# Altium schematic sheet Power Sheet.SchDoc
size A4; SheetNumber: 2; SheetTotal: 5
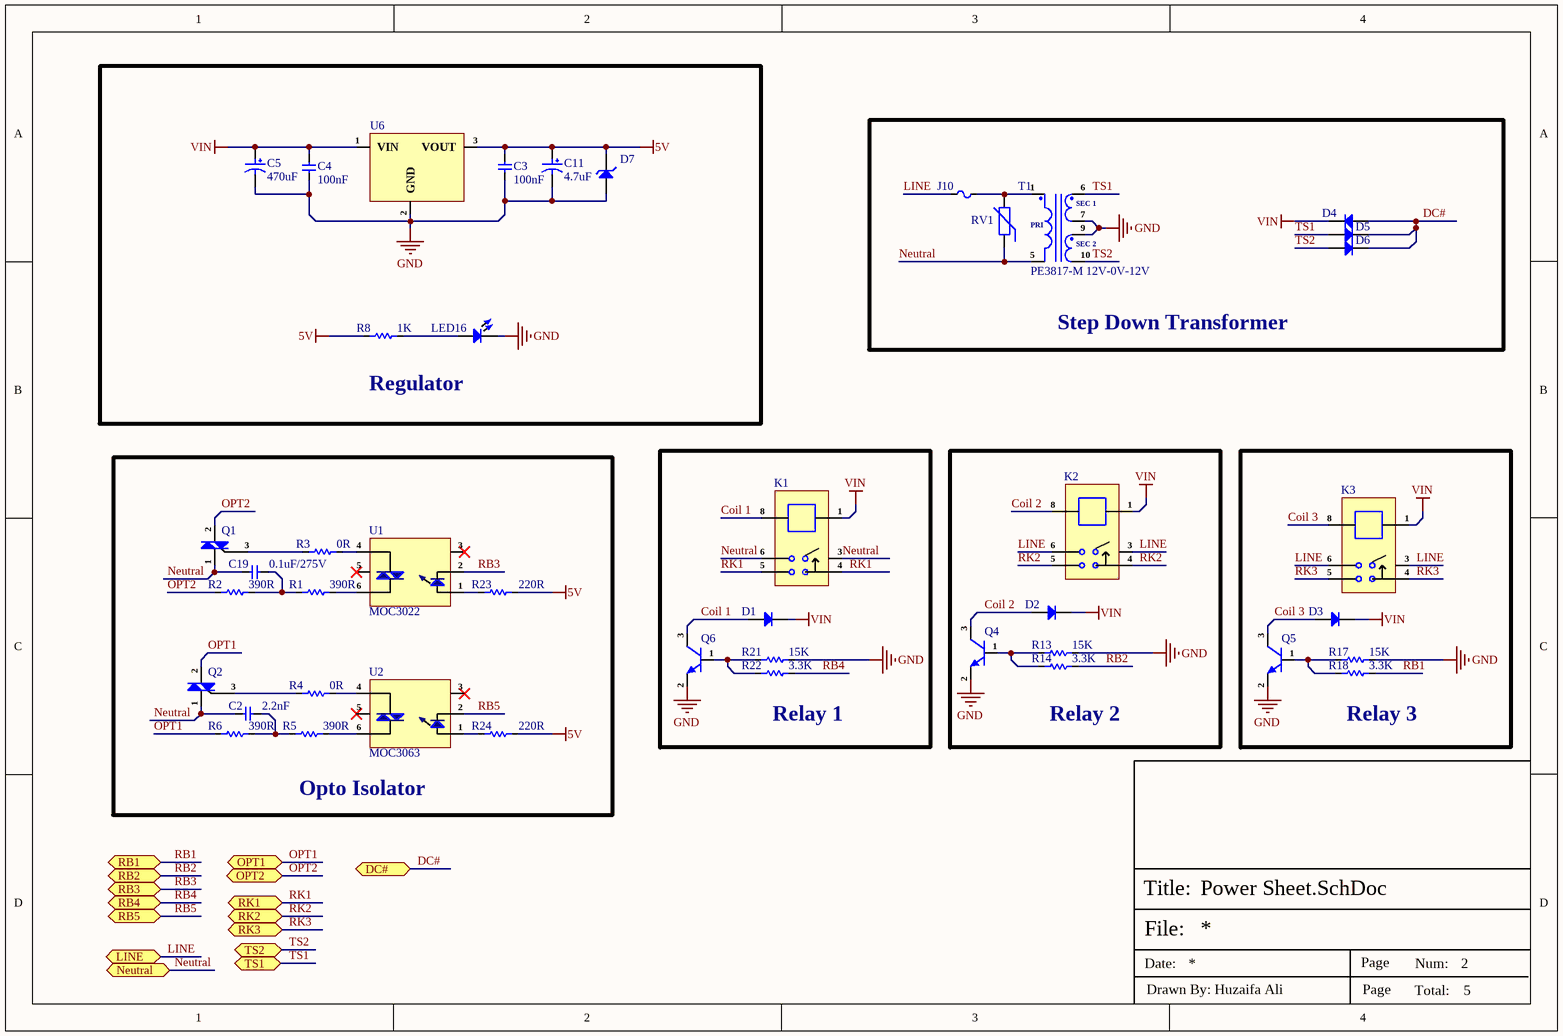
[diagram p0: Power Sheet.SchDoc]

## Parts
C2  2.2nF  [R08E1E222MN0B0S0N0]
C3  100nF  [Cap-0603]
C4  100nF  [Cap-0603]
C5  470uF  [GR1V471M1013]
C11  4.7uF  [ERS1KM4R7D11OT]
C19  0.1uF/275V  [MPX104K31C3KN15600]
D1  1N4148W-7-F  [SOD-123]  (value not drawn)
D2  1N4148W-7-F  [SOD-123]  (value not drawn)
D3  1N4148W-7-F  [SOD-123]  (value not drawn)
D4  1N4007  [DO-41]  (value not drawn)
D5  1N4007  [DO-41]  (value not drawn)
D6  1N4007  [DO-41]  (value not drawn)
D7  P6KE7.5A  [DO-15]  (value not drawn)
J10  0PTF0078P  [0PTF0078P]  (value not drawn)
K1  G5RL-1A-E-HRDC12  [G5RL-1A-E-HRDC12]  (value not drawn)
K2  G5RL-1A-E-HRDC12  [G5RL-1A-E-HRDC12]  (value not drawn)
K3  G5RL-1A-E-HRDC12  [G5RL-1A-E-HRDC12]  (value not drawn)
LED16  Blue  [LED-0603]  (value not drawn)
Q1  BTA16-600BRG  [TO-220]  (value not drawn)
Q2  BTA16-600BRG  [TO-220]  (value not drawn)
Q4  BC817 6B 160-400  [SOT-23]  (value not drawn)
Q5  BC817 6B 160-400  [SOT-23]  (value not drawn)
Q6  BC817 6B 160-400  [SOT-23]  (value not drawn)
R1  390R  [TH390R]
R2  390R  [TH390R]
R3  0R  [MFR50S-T-52-0R]
R4  0R  [MFR50S-T-52-0R]
R5  390R  [TH390R]
R6  390R  [TH390R]
R8  1K  [Res-0603]
R13  15K  [Res-0603]
R14  3.3K  [Res-0603]
R17  15K  [Res-0603]
R18  3.3K  [Res-0603]
R21  15K  [Res-0603]
R22  3.3K  [Res-0603]
R23  220R  [Res-0603]
R24  220R  [Res-0603]
RV1  14D431K  [14D431K]  (value not drawn)
T1  PE3817-M 12V-0V-12V  [PE3817-M 12V-0V-12V]
U1  MOC3022  [6 Pin Dip]
U2  MOC3063  [6 Pin Dip]
U6  L7805ABV  [TO-220]  (value not drawn)

## Blocks framed on the sheet
Regulator: C3-C5 C11 D7 LED16 R8 U6
Step Down Transformer: D4-D6 J10 RV1 T1
Opto Isolator: C2 C19 Q1 Q2 R1-R6 R23 R24 U1 U2
Relay 1: D1 K1 Q6 R21 R22
Relay 2: D2 K2 Q4 R13 R14
Relay 3: D3 K3 Q5 R17 R18

## Ports
DC# (bidir, see Top Sheet[2B], Controller Sheet[1D]), LINE (bidir, see Top Sheet[2A], Connector Sheet[1D]), Neutral (bidir, see Top Sheet[2B], Connector Sheet[1D]), OPT1 (bidir, see Top Sheet[2B], Connector Sheet[1D]), OPT2 (bidir, see Top Sheet[2B], Connector Sheet[1D]), RB1 (bidir, see Top Sheet[2B], Controller Sheet[1D]), RB2 (bidir, see Top Sheet[2B], Controller Sheet[1D]), RB3 (bidir, see Top Sheet[2B], Controller Sheet[1D]), RB4 (bidir, see Top Sheet[2B], Controller Sheet[1D]), RB5 (bidir, see Top Sheet[2B], Controller Sheet[1D]), RK1 (bidir, see Top Sheet[2B], Connector Sheet[1D]), RK2 (bidir, see Top Sheet[2B], Connector Sheet[1D]), RK3 (bidir, see Top Sheet[2B], Connector Sheet[1D]), TS1 (bidir, see Top Sheet[2B], Connector Sheet[1D]), TS2 (bidir, see Top Sheet[2B], Connector Sheet[1D])

## Nets
5V: C3.1 C11.1 D7.1(K) R8.1 R23.2 R24.2 U6.3(VOUT)
GND: C3.2 C4.1 C5.2 C11.2 D7.2(A) LED16.2 Q4.2(E) Q5.2(E) Q6.2(E) R13.2 R17.2 R21.2 T1.7 T1.9 U6.2(GND)
VIN: C4.2 C5.1 D1.2(K) D2.2(K) D3.2(K) D4.2(K) K1.1 K2.1 K3.1 U6.1(VIN)
Coil 1: D1.1(A) K1.8 Q6.3(C)
Coil 2: D2.1(A) K2.8 Q4.3(C)
Coil 3: D3.1(A) K3.8 Q5.3(C)
DC#: D4.1(A) D5.2(K) D6.2(K) ; port DC#
LINE: J10.2 K2.3 K2.6 K3.3 K3.6 ; port LINE
Neutral: C2.1 C19.1 K1.3 K1.6 Q1.1(A1) Q2.1(A1) RV1.1 T1.5 ; port Neutral
OPT1: Q2.2(A2) R6.1 ; port OPT1
OPT2: Q1.2(A2) R2.1 ; port OPT2
RB1: R18.2 ; port RB1
RB2: R14.2 ; port RB2
RB3: U1.2(Ca) ; port RB3
RB4: R22.2 ; port RB4
RB5: U2.2(Ca) ; port RB5
RK1: K1.4 K1.5 ; port RK1
RK2: K2.4 K2.5 ; port RK2
RK3: K3.4 K3.5 ; port RK3
TS1: D5.1(A) T1.6 ; port TS1
TS2: D6.1(A) T1.10 ; port TS2
NetC2_2: C2.2 R5.1 R6.2
NetC19_2: C19.2 R1.1 R2.2
NetJ10_1: J10.1 RV1.2 T1.1
NetLED16_1: LED16.1 R8.2
NetQ1_3: Q1.3(G) R3.1
NetQ2_3: Q2.3(G) R4.1
NetQ4_1: Q4.1(B) R13.1 R14.1
NetQ5_1: Q5.1(B) R17.1 R18.1
NetQ6_1: Q6.1(B) R21.1 R22.1
NetR1_2: R1.2 U1.6(Terminal)
NetR3_2: R3.2 U1.4(Terminal)
NetR4_2: R4.2 U2.4(Terminal)
NetR5_2: R5.2 U2.6(Terminal)
NetR23_1: R23.1 U1.1(An)
NetR24_1: R24.1 U2.1(An)

Not connected (* = marked no-connect by the designer): U1 3(NC)* 5(Substrate)*; U2 3(NC)* 5(Substrate)*

## Notes on the sheet
- File:
- Title:
- Date:
- Page
- Num:
- Total:
- Drawn By: Huzaifa Ali
- (in symbol PE3817-M 12V-0V-12V) SEC 1; PRI; SEC 2

## Library data of the parts
C2 = R08E1E222MN0B0S0N0: ±20% 2.2nF Y5U 2kV Plugin,P=7.5mm Ceramic Disc Capacitors ROHS; Manufacturer: STE; Manufacturer Part Number: R08E1E222MN0B0S0N0; Package: Plugin,P=7.5mm; LCSC Part Number: C2914748; Item Type: Ceramic Disc Capacitor; ComponentLink1Description: LCSC; ComponentLink1URL: https://www.lcsc.com/product-detail/Ceramic-Disc-Capacitors_STE-Songtian-Elec-R08E1E222MN0B0S0N0_C2914748.html
C3 C4 = CC0603KRX5R9BB104: CAP CER 0.1UF 50V X5R 0603; Manufacturer: Yageo; Tolerance: 10%; Item Type: Capacitor; Supplier 1: Digi-Key; Manufacturer Part Number: CC0603KRX5R9BB104; RoHS: Yes; Category: Ceramic Capacitors; Stock 1: 152253; Pricing 1: 1=0.10000, 10=0.05200, 50=0.02820, 100=0.02310, 500=0.01648, 1000=0.01294 (USD); Mount: Surface Mount; Case/Package: 0603; Case Code (Imperial): 0603; Case Code (Metric): 1608; Weight: 7.1E-05oz; Min Operating Temperature: -55°C; Max Operating Temperature: 85°C; Capacitance: 100nF; Packaging: Tape and Reel; Voltage Rating: 50V; Dielectric: X5R; Termination: SMD/SMT; Voltage Rating (DC): 50V; Package Quantity: 4000; Length: 0.063inch; Width: 0.031inch; Thickness: 0.035inch; Lead Free: Lead Free; Halogen Free: Halogen Free; ComponentLink1URL: http://www.mouser.com/ds/2/447/Yageo_UPY-GP_NP0_16V-to-50V_9-358835.pdf?src-supplier=Mouser; ComponentLink1Description: http://www.mouser.com/ds/2/447/Yageo_UPY-GP_NP0_16V-to-50V_9-358835.pdf?src-supplier=Mouser; ComponentLink2URL: https://www.yageo.com/upload/media/product/productsearch/datasheet/mlcc/UPY-GPHC_X5R_4V-to-50V_26.pdf?src-supplier=Digi-Key; ComponentLink2Description: https://www.yageo.com/upload/media/product/productsearch/datasheet/mlcc/UPY-GPHC_X5R_4V-to-50V_26.pdf?src-supplier=Digi-Key; ComponentLink3URL: http://www.yageo.com/exep/pages/download/literatures/ProductSelectionGuide%202014_Final_2.pdf?src-supplier=Digi-Key; ComponentLink3Description: http://www.yageo.com/exep/pages/download/literatures/ProductSelectionGuide%202014_Final_2.pdf?src-supplier=Digi-Key; Supplier Part Number 1: 311-4046-1-ND; LCSC Part Number: C110022
C5 = GR1V471M1013: 470uF 35V ±20% Plugin,D10xL13mm Aluminum Electrolytic Capacitors - Leaded ROHS; Manufacturer: ROQANG; Manufacturer Part Number: GR1V471M1013; Package: Plugin,D10xL13mm; LCSC Part Number: C2873995; Item Type: Capacitor; ComponentLink1Description: LCSC; ComponentLink1URL: https://www.lcsc.com/product-detail/span-style-background-color-ff0-Aluminum-span-span-style-background-color-ff0-Electrolytic-span-span-style-background-color-ff0-Capacitors-span-span-style-background-color-ff0-Leaded-span_ROQANG-GR1V471M1013_C2873995.html
C11 = ERS1KM4R7D11OT: 4.7uF 100V ±20% Plugin,D5xL11mm Aluminum Electrolytic Capacitors - Leaded ROHS; Manufacturer: AISHI(Aihua Group); Manufacturer Part Number: ERS1KM4R7D11OT; Package: Plugin,D5xL11mm; LCSC Part Number: C106689; Item Type: Capacitor; ComponentLink1Description: LCSC; ComponentLink1URL: https://www.lcsc.com/product-detail/Aluminum-Electrolytic-Capacitors-Leaded_AISHI-Aihua-Group-ERS1KM4R7D11OT_C106689.html
C19 = MPX104K31C3KN15600: 100nF ±10% X2 Plugin,P=10mm Suppression Capacitors ROHS; Manufacturer: KNSCHA; Manufacturer Part Number: MPX104K31C3KN15600; Package: Plugin,P=10mm; LCSC Part Number: C489079; Item Type: Capacitor; ComponentLink1Description: LCSC; ComponentLink1URL: https://www.lcsc.com/product-detail/Suppression-Capacitors_KNSCHA-MPX104K31C3KN15600_C489079.html
D1-D3 = 1N4148W-7-F: DIODE GEN PURP 100V 300MA SOD123; Manufacturer: Diodes; Forward Current: 150mA; Reverse Recovery Time: 4ns; Max Forward Surge Current (Ifsm): 2A; Element Configuration: Single; Max Reverse Current: 1uA; Forward Voltage: 1.25V; Power Dissipation: 400mW; Polarity: Standard; Voltage Rating (DC): 75V; Value: 2pF; Supplier 1: Future Electronics; Manufacturer Part Number: 1N4148W-7-F; RoHS: Yes; Category: Rectifier Diodes; Stock 1: 32931000; Pricing 1: 3000=0.01840, 12000=0.01760, 45000=0.01690, 120000=0.01640, 300000=0.01560 (USD); Mounting Technology: Surface Mount; Pins: 2; Weight: 0.000353oz; Contact Plating: Tin,Matte; Min Operating Temperature: -65°C; Max Operating Temperature: 150°C; Packaging: Tape and Reel; Max Repetitive Reverse Voltage (Vrrm): 100V; Peak Non-Repetitive Surge Current: 2A; Voltage: 100V; Max Surge Current: 2A; Package Quantity: 3000; Recovery Time: 4ns; Average Rectified Current: 300mA; Power Rating: 400mW; Current Rating: 150mA; Output Current: 150mA; Max Reverse Voltage (DC): 100V; Series: -; Reverse Recovery Time-Max: 4ns; Length: 2.85mm; Width: 1.7mm; Height: 1.25mm; Radiation Hardening: No; RoHS Compliant: Yes; Reach SVHC Compliant: Yes; Lead Free: Lead Free; ComponentLink1URL: https://datasheet.ciiva.com/1179/1915529-1179304.pdf?src-supplier=Element14; ComponentLink1Description: https://datasheet.ciiva.com/1179/1915529-1179304.pdf?src-supplier=Element14; ComponentLink2URL: https://datasheet.ciiva.com/22695/1915529-22695239.pdf?src-supplier=Element14; ComponentLink2Description: https://datasheet.ciiva.com/22695/1915529-22695239.pdf?src-supplier=Element14; ComponentLink3URL: https://datasheet.ciiva.com/8300/ds30086-8300392.pdf?src-supplier=Avnet; ComponentLink3Description: https://datasheet.ciiva.com/8300/ds30086-8300392.pdf?src-supplier=Avnet; ComponentLink4URL: https://datasheet.ciiva.com/15219/getdatasheetpartid-110030-15219548.pdf?src-supplier=Verical; ComponentLink4Description: https://datasheet.ciiva.com/15219/getdatasheetpartid-110030-15219548.pdf?src-supplier=Verical; ComponentLink5URL: https://datasheet.ciiva.com/8303/ds30086-8303197.pdf?src-supplier=Avnet; ComponentLink5Description: https://datasheet.ciiva.com/8303/ds30086-8303197.pdf?src-supplier=Avnet; ComponentLink6URL: https://datasheet.ciiva.com/911/ds30086-911735.pdf?src-supplier=Digi-Key; ComponentLink6Description: https://datasheet.ciiva.com/911/ds30086-911735.pdf?src-supplier=Digi-Key; ComponentLink7URL: https://datasheet.ciiva.com/911/ds30086-911736.pdf?src-supplier=Digi-Key; ComponentLink7Description: https://datasheet.ciiva.com/911/ds30086-911736.pdf?src-supplier=Digi-Key; ComponentLink8URL: https://datasheet.ciiva.com/911/ds30086-911734.pdf?src-supplier=Digi-Key; ComponentLink8Description: https://datasheet.ciiva.com/911/ds30086-911734.pdf?src-supplier=Digi-Key; ComponentLink9URL: https://datasheet.ciiva.com/4435/ds30086-4435128.pdf?src-supplier=Mouser; ComponentLink9Description: https://datasheet.ciiva.com/4435/ds30086-4435128.pdf?src-supplier=Mouser; Supplier Part Number 1: 7634694; LCSC Part Number: C83528; Item Type: Diode
D4-D6 = 1N4007: 1A 1000V 1.1V@2A DO-41 Diodes - General Purpose ROHS; Manufacturer: JUXING; Item Type: Diode; Manufacturer Part Number: 1N4007; Package: DO-41; LCSC Part Number: C3011149; ComponentLink1Description: LCSC; ComponentLink1URL: https://www.lcsc.com/product-detail/Diodes-General-Purpose_JUXING-1N4007_C3011149.html
D7 = P6KE7.5A: TVS DIODE 6.4VWM 11.3VC DO204AC; Manufacturer: Littelfuse; Reverse Voltage: 6.4V; Supplier: Future Electronics; Supplier Part Number: 9017454; Manufacturer Part Number: P6KE7.5A; RoHS: Yes; Category: TVS Diodes; Stock: 2812; Pricing: 1=0.395, 15=0.325, 100=0.27, 400=0.235, 2000=0.189 (USD); ComponentLink1URL: https://datasheet.ciiva.com/15143/getdatasheetpartid-152329-15143807.pdf?src-supplier=Verical; ComponentLink1Description: https://datasheet.ciiva.com/15143/getdatasheetpartid-152329-15143807.pdf?src-supplier=Verical; ComponentLink2URL: https://datasheet.ciiva.com/331/littelfuse-tvs-diode-p6ke-datasheet-pdf-331007.pdf?src-supplier=Digi-Key; ComponentLink2Description: https://datasheet.ciiva.com/331/littelfuse-tvs-diode-p6ke-datasheet-pdf-331007.pdf?src-supplier=Digi-Key; ComponentLink3URL: https://datasheet.ciiva.com/331/littelfuse-tvs-diode-p6ke-datasheet-pdf-331031.pdf?src-supplier=Digi-Key; ComponentLink3Description: https://datasheet.ciiva.com/331/littelfuse-tvs-diode-p6ke-datasheet-pdf-331031.pdf?src-supplier=Digi-Key; ComponentLink4URL: https://datasheet.ciiva.com/331/littelfuse-tvs-diode-p6ke-datasheet-pdf-331032.pdf?src-supplier=Digi-Key; ComponentLink4Description: https://datasheet.ciiva.com/331/littelfuse-tvs-diode-p6ke-datasheet-pdf-331032.pdf?src-supplier=Digi-Key; ComponentLink5URL: https://datasheet.ciiva.com/4510/littelfuse-tvs-diode-p6ke-48586-4510890.pdf?src-supplier=Mouser; ComponentLink5Description: https://datasheet.ciiva.com/4510/littelfuse-tvs-diode-p6ke-48586-4510890.pdf?src-supplier=Mouser; ComponentLink6URL: https://datasheet.ciiva.com/8062/littelfuse-tvs-diode-p6ke-8062215.pdf?src-supplier=Element14; ComponentLink6Description: https://datasheet.ciiva.com/8062/littelfuse-tvs-diode-p6ke-8062215.pdf?src-supplier=Element14; LCSC Part Number: C1975000; Item Type: Diode
J10 = 0PTF0078P: Fuse Holder 6.3A 250VDC/250VAC Through Hole Pin; Manufacturer: Littelfuse; Supplier: Future Electronics; Supplier Part Number: 9114913; Manufacturer Part Number: 0PTF0078P; RoHS: Yes; Category: Fuse Holders; Stock: 4000; Pricing: 2000=0.118, 6000=0.114, 10000=0.113, 20000=0.111, 40000=0.107 (USD); ComponentLink1URL: https://datasheet.ciiva.com/18456/ptf075-77-78-18456970.pdf?src-supplier=Digi-Key; ComponentLink1Description: https://datasheet.ciiva.com/18456/ptf075-77-78-18456970.pdf?src-supplier=Digi-Key; LCSC Part Number: C2760101; Item Type: Fuse Holder
K1-K3 = G5RL-1A-E-HRDC12: RELAY GEN PURPOSE SPST 16A 12V; Manufacturer: Omron; Supplier: Rs; Supplier Part Number: 6839227; Manufacturer Part Number: G5RL-1A-E-HRDC12; RoHS: Yes; Category: Power Relays; Stock: 213; Pricing: 1=4.64, 25=3.67, 50=3.47, 100=3.31, 250=2.96 (GBP); ComponentLink1URL: https://omronfs.omron.com/en_US/ecb/products/pdf/en-g5rl.pdf?src-supplier=Digi-Key; ComponentLink1Description: https://omronfs.omron.com/en_US/ecb/products/pdf/en-g5rl.pdf?src-supplier=Digi-Key; ComponentLink2URL: http://datasheet.octopart.com/G5RL-1A-E-HR-DC12-Omron-datasheet-10910182.pdf?src-supplier=Mouser; ComponentLink2Description: http://datasheet.octopart.com/G5RL-1A-E-HR-DC12-Omron-datasheet-10910182.pdf?src-supplier=Mouser; ComponentLink3URL: http://datasheet.octopart.com/G5RL-1A-E-HR-DC12-Omron-datasheet-10910182.pdf?src-supplier=Farnell; ComponentLink3Description: http://datasheet.octopart.com/G5RL-1A-E-HR-DC12-Omron-datasheet-10910182.pdf?src-supplier=Farnell; ComponentLink4URL: http://datasheet.octopart.com/G5RL-1A-E-HR-DC12-Omron-datasheet-10910182.pdf?src-supplier=Avnet; ComponentLink4Description: http://datasheet.octopart.com/G5RL-1A-E-HR-DC12-Omron-datasheet-10910182.pdf?src-supplier=Avnet; ComponentLink5URL: http://datasheet.octopart.com/G5RL-1A-E-HR-DC12-Omron-datasheet-10910182.pdf?src-supplier=Digi-Key; ComponentLink5Description: http://datasheet.octopart.com/G5RL-1A-E-HR-DC12-Omron-datasheet-10910182.pdf?src-supplier=Digi-Key; ComponentLink6URL: http://datasheet.octopart.com/G5RL-1A-E-HR-DC12-Omron-datasheet-10910182.pdf?src-supplier=Arrow+Electronics; ComponentLink6Description: http://datasheet.octopart.com/G5RL-1A-E-HR-DC12-Omron-datasheet-10910182.pdf?src-supplier=Arrow+Electronics; ComponentLink7URL: http://datasheet.octopart.com/G5RL-1A-E-HR-DC12-Omron-datasheet-10910182.pdf?src-supplier=Onlinecomponents.com; ComponentLink7Description: http://datasheet.octopart.com/G5RL-1A-E-HR-DC12-Omron-datasheet-10910182.pdf?src-supplier=Onlinecomponents.com; ComponentLink8URL: http://datasheet.octopart.com/G5RL-1A-E-HR-DC12-Omron-datasheet-10910182.pdf?src-supplier=Newark; ComponentLink8Description: http://datasheet.octopart.com/G5RL-1A-E-HR-DC12-Omron-datasheet-10910182.pdf?src-supplier=Newark; ComponentLink9URL: https://datasheet.octopart.com/G5RL-1A-E-HR-DC12-Omron-datasheet-87796980.pdf?src-supplier=Master+Electronics; ComponentLink9Description: https://datasheet.octopart.com/G5RL-1A-E-HR-DC12-Omron-datasheet-87796980.pdf?src-supplier=Master+Electronics; ComponentLink10URL: http://datasheet.octopart.com/G5RL-1A-E-HR-DC12-Omron-datasheet-10910182.pdf?src-supplier=LCSC; ComponentLink10Description: http://datasheet.octopart.com/G5RL-1A-E-HR-DC12-Omron-datasheet-10910182.pdf?src-supplier=LCSC; ComponentLink11URL: http://datasheet.octopart.com/G5RL-1A-E-HR-DC12-Omron-datasheet-10910182.pdf?src-supplier=Today+Components; ComponentLink11Description: http://datasheet.octopart.com/G5RL-1A-E-HR-DC12-Omron-datasheet-10910182.pdf?src-supplier=Today+Components; LCSC Part Number: C231374; Item Type: Relay
LED16 = NCD0603B3: blue 0603 Light Emitting Diodes (LED) ROHS; Manufacturer: Foshan NationStar Optoelectronics; Manufacturer Part Number: NCD0603B3; Package: 0603; LCSC Part Number: C158101; Item Type: LED; ComponentLink1Description: LCSC; ComponentLink1URL: https://www.lcsc.com/product-detail/Light-Emitting-Diodes-LED_Foshan-NationStar-Optoelectronics-NCD0603B3_C158101.html
Q1 Q2 = BTA16-600BRG: TRIAC Standard 600V 16A Through Hole TO-220AB; Manufacturer: STMicroelectronics; Supplier: Mouser; Supplier Part Number: 511-BTA16-600B; Manufacturer Part Number: BTA16-600BRG; RoHS: Yes; Category: TRIACs; Stock: 13093; Pricing: 1=2.4, 10=2.14, 50=2.14, 100=1.74, 1000=1.2, 10000=1.11 (USD); ComponentLink1URL: https://datasheet.ciiva.com/15140/getdatasheetpartid-185587-15140605.pdf?src-supplier=Verical; ComponentLink1Description: https://datasheet.ciiva.com/15140/getdatasheetpartid-185587-15140605.pdf?src-supplier=Verical; ComponentLink2URL: https://datasheet.ciiva.com/3054/cd00002265-3054339.pdf?src-supplier=Avnet; ComponentLink2Description: https://datasheet.ciiva.com/3054/cd00002265-3054339.pdf?src-supplier=Avnet; ComponentLink3URL: https://datasheet.ciiva.com/16397/cd00002265-16397087.pdf?src-supplier=Future+Electronics; ComponentLink3Description: https://datasheet.ciiva.com/16397/cd00002265-16397087.pdf?src-supplier=Future+Electronics; ComponentLink4URL: https://datasheet.ciiva.com/1218/1699992-1218264.pdf?src-supplier=Farnell; ComponentLink4Description: https://datasheet.ciiva.com/1218/1699992-1218264.pdf?src-supplier=Farnell; ComponentLink5URL: https://datasheet.ciiva.com/14164/tfstm-triacs-bta-btb-16-xxx-en-14164139.pdf?src-supplier=Distrelec; ComponentLink5Description: https://datasheet.ciiva.com/14164/tfstm-triacs-bta-btb-16-xxx-en-14164139.pdf?src-supplier=Distrelec; ComponentLink6URL: https://datasheet.ciiva.com/4748/cd00002265-4748742.pdf?src-supplier=Mouser; ComponentLink6Description: https://datasheet.ciiva.com/4748/cd00002265-4748742.pdf?src-supplier=Mouser; ComponentLink7URL: https://datasheet.ciiva.com/1197/1699992-1197134.pdf?src-supplier=Element14; ComponentLink7Description: https://datasheet.ciiva.com/1197/1699992-1197134.pdf?src-supplier=Element14; ComponentLink8URL: https://datasheet.ciiva.com/1198/1699992-1198139.pdf?src-supplier=Element14; ComponentLink8Description: https://datasheet.ciiva.com/1198/1699992-1198139.pdf?src-supplier=Element14; Item Type: TRIAC
Q4-Q6 = BC817 6B 160-400: 45V 300mW 100@100mA,1V 500mA NPN SOT-23 Bipolar Transistors - BJT ROHS; Manufacturer: DOWO; Manufacturer Part Number: BC817 6B 160-400; Package: SOT-23; LCSC Part Number: C371086; Item Type: Transistor; ComponentLink1Description: LCSC; ComponentLink1URL: https://www.lcsc.com/product-detail/Bipolar-Transistors-BJT_DOWO-BC817-6B-160-400_C371086.html
R1 R2 R5 R6 = TH390R: Metal Oxide Resistors 390Ω 1W ±350ppm/℃ ±5% Plugin Through Hole Resistors ROHS; Parameter 1: *; Parameter 2: *; Parameter 3: *; Parameter 4: *; Parameter 5: *; ComponentLink1Description: LCSC; ComponentLink1URL: https://www.lcsc.com/product-detail/Through-Hole-Resistors_VO-MO1W-390-5-6T63_C479244.html
R3 R4 = MFR50S-T-52-0R: Metal Film Resistors 0Ω 500mW Plugin Through Hole Resistors ROHS; Manufacturer: YAGEO; Manufacturer Part Number: MFR50S-T-52-0R; Package: Plugin; LCSC Part Number: C173163; Item Type: Through Hole Resistor; ComponentLink1Description: LCSC; ComponentLink1URL: https://www.lcsc.com/product-detail/Through-Hole-Resistors_YAGEO-MFR50S-T-52-0R_C173163.html
R8 = RT0603DRD071KL: RES SMD 1K OHM 0.5% 1/10W 0603; Manufacturer: Yageo; Resistance: 1kR; Temperature Coefficient: 25ppm/°C; Power Rating: 100mW; Voltage Rating: 75V; Voltage Rating (DC): 50V; Supplier 1: Digi-Key; Manufacturer Part Number: RT0603DRD071KL; Stock 1: 178947; Pricing 1: 1=0.2, 10=0.167, 100=0.0651, 1000=0.02725, 2500=0.02498 (USD); Case/Package: 0603; Contact Plating: Tin,Matte; Case Code (Metric): 1608; Case Code (Imperial): 0603; Min Operating Temperature: -55°C; Max Operating Temperature: 125°C; Tolerance: 0.5%; Composition: Thin Film; Packaging: Tape and Reel; Termination: SMD/SMT; Radiation Hardening: No; Lead Free: Lead Free; ComponentLink1URL: http://www.mouser.com/ds/2/447/yageodocoutput-1125656.pdf?src-supplier=Mouser; ComponentLink1Description: http://www.mouser.com/ds/2/447/yageodocoutput-1125656.pdf?src-supplier=Mouser; ComponentLink2URL: http://www.yageo.com/documents/recent/PYu-RT_1-to-0.05_RoHS_L_6.pdf?src-supplier=Avnet; ComponentLink2Description: http://www.yageo.com/documents/recent/PYu-RT_1-to-0.05_RoHS_L_6.pdf?src-supplier=Avnet; Supplier Part Number 1: 311-1.0KDDKR-ND; LCSC Part Number: C165964
R13 R17 R21 = RC0603FR-0715KL: RES 15K OHM 1% 1/10W 0603; Manufacturer: Yageo; Temperature Coefficient: 100ppm/°C; Value: 15kR; Power Rating: 100mW; Voltage Rating (DC): 50V; Item Type: Resistor; Supplier 1: Future Electronics; Manufacturer Part Number: RC0603FR-0715KL; RoHS: Yes; Category: Chip SMD Resistors; Stock 1: 13310000; Pricing 1: 5000=0.00150, 50000=0.00140, 100000=0.00140, 200000=0.00140, 375000=0.00140, 625000=0.00130, 1000000=0.00130, 2000000=0.00120, 3750000=0.00120 (USD); Case/Package: 0603; Pins: 2; Case Code (Metric): 1608; Case Code (Imperial): 0603; Min Operating Temperature: -55°C; Max Operating Temperature: 155°C; Tolerance: 1%; Packaging: Tape and Reel; Resistor Type: Thick Film; Series: RC; Package Quantity: 1; Voltage Rating: 50V; Number of Terminations: 2; Termination: SMD/SMT; Max Power Dissipation: 100mW; Features: Moisture Resistant; Resistance Tolerance: 1%; Construction: Rectangular; Length: 0.063inch; Width: 0.031inch; Height: 0.022inch; Depth: 0.8mm; Lead Free: Lead Free; RoHS Compliant: Yes; Military Standard: Not; Supplier Part Number 1: 4083945; LCSC Part Number: C114661
R14 R18 R22 = RC0603FR-073K3L: RES SMD 3.3K OHM 1% 1/10W 0603; Manufacturer: Yageo Phycomp; Temperature Coefficient: 100ppm/°C; Resistance: 3.3kR; Voltage Rating (DC): 50V; Power Rating: 100mW; Item Type: Resistor; Supplier 1: Digi-Key; Manufacturer Part Number: RC0603FR-073K3L; Stock 1: 6863000; Pricing 1: 1=0.1, 10=0.024, 100=0.0097, 1000=0.00437, 2500=0.00379 (USD); Mount: Surface Mount; Case/Package: 0603; Number of Pins: 2; Min Operating Temperature: -55°C; Max Operating Temperature: 155°C; Tolerance: 1%; Packaging: Cut Tape; Length: 1.6mm; Height: 0.45mm; Width: 800um; Depth: 0.8mm; REACH SVHC: No SVHC; Lead Free: Lead Free; Supplier Part Number 1: 311-3.30KHRCT-ND; LCSC Part Number: C108078
R23 R24 = RC0603FR-07220RL: RES SMD 220 OHM 1% 1/10W 0603; Manufacturer: Yageo; Temperature Coefficient: 100ppm/°C; Voltage Rating (DC): 50V; Power Rating: 100mW; Item Type: Resistor; Supplier 1: Digi-Key; Manufacturer Part Number: RC0603FR-07220RL; Stock 1: 5843995; Pricing 1: 1=0.1, 10=0.023, 100=0.0094, 1000=0.00421, 2500=0.00366 (USD); Case/Package: 0603; Number of Pins: 2; Case Code (Imperial): 0603; Case Code (Metric): 1608; Min Operating Temperature: -55°C; Max Operating Temperature: 155°C; Resistance: 220R; Tolerance: 1%; Composition: Thick Film; Packaging: Tape and Reel; Voltage Rating: 50V; Package Quantity: 1; Termination: SMD/SMT; Number of Terminations: 2; Military Standard: Not; Max Power Dissipation: 100mW; Features: Moisture Resistant; Length: 1.6mm; Height: 0.022inch; Width: 0.031inch; Depth: 0.8mm; REACH SVHC: No SVHC; Lead Free: Lead Free; ComponentLink1URL: http://www.yageo.com/documents/recent/PYu-RC_Group_51_RoHS_L_10.pdf?src-supplier=Digi-Key; ComponentLink1Description: http://www.yageo.com/documents/recent/PYu-RC_Group_51_RoHS_L_10.pdf?src-supplier=Digi-Key; ComponentLink2URL: http://www.farnell.com/datasheets/1868787.pdf?src-supplier=Element14; ComponentLink2Description: http://www.farnell.com/datasheets/1868787.pdf?src-supplier=Element14; Supplier Part Number 1: 311-220HRCT-ND; LCSC Part Number: C107696
RV1 = 14D431K: 710V 350V 275V 387V~473V Plugin Varistors ROHS; Manufacturer: Hongzhi Elec; Manufacturer Part Number: 14D431K; Package: Plugin; LCSC Part Number: C137830; Item Type: Varistor; ComponentLink1Description: LCSC; ComponentLink1URL: https://www.lcsc.com/product-detail/Varistors_Hongzhi-Elec-14D431K_C137830.html
T1 = PE3817-M 12V-0V-12V: Vacuum Epoxy Encapsulated,PCB mounting, Pirmary voltage: 110V/220V/230V/380.; Manufacturer: YHDC; Item Type: Transformer; Manufacturer Part Number: PE3817-M; ComponentLink1Description: LCSC; ComponentLink1URL: https://vi.aliexpress.com/item/32737640605.html?spm=a2g0o.productlist.main.1.9e8c53b8DhDv65&algo_pvid=dfbf5521-a82b-4f41-a663-463eb69d6f12&algo_exp_id=dfbf5521-a82b-4f41-a663-463eb69d6f12-0&pdp_npi=4%40dis%21USD%212.76%212.76%21%21%212.76%21%21%402101fb1816980403049242369e75cd%2112000034040116544%21sea%21PK%21821782294%21&curPageLogUid=ULPY5vETnG3z&gatewayAdapt=glo2vnm
U1 = MOC3022: OPTOISOLATOR 5KV TRIAC 6DIP; Manufacturer: Vishay Lite-On; Item Type: Optocoupler; Supplier: Rs; Supplier Part Number: 1689685; Manufacturer Part Number: MOC3022; RoHS: Yes; Category: Optocouplers; Stock: 90; Pricing: 65=0.284 (GBP); ComponentLink1URL: https://datasheet.ciiva.com/11772/0900766b80de6ded-11772106.pdf?src-supplier=Rs; ComponentLink1Description: https://datasheet.ciiva.com/11772/0900766b80de6ded-11772106.pdf?src-supplier=Rs; ComponentLink2URL: https://datasheet.ciiva.com/2093/s-110-moc3020thrumoc3023series-2093015.pdf?src-supplier=Digi-Key; ComponentLink2Description: https://datasheet.ciiva.com/2093/s-110-moc3020thrumoc3023series-2093015.pdf?src-supplier=Digi-Key; LCSC Part Number: C115466
U2 = MOC3063: OPTOISOLATOR 5KV TRIAC 6DIP; Manufacturer: Vishay Lite-On; Item Type: IC; Supplier: Rs; Supplier Part Number: 1689692; Manufacturer Part Number: MOC3063; RoHS: Yes; Category: Optocouplers; Stock: 1109; Pricing: 65=0.362 (GBP); ComponentLink1URL: https://datasheet.ciiva.com/15118/getdatasheetpartid-141776-15118268.pdf?src-supplier=Verical; ComponentLink1Description: https://datasheet.ciiva.com/15118/getdatasheetpartid-141776-15118268.pdf?src-supplier=Verical; ComponentLink2URL: https://datasheet.ciiva.com/11771/0900766b80de6dee-11771947.pdf?src-supplier=Rs; ComponentLink2Description: https://datasheet.ciiva.com/11771/0900766b80de6dee-11771947.pdf?src-supplier=Rs; LCSC Part Number: C78487
U6 = L7805ABV: IC REG LINEAR 5V 1.5A TO220AB; Manufacturer: STMicroelectronics; Max Supply Voltage: 35V; Number of Outputs: 1; Max Output current: 1A; Polarity: Positive; Quiescent Current: 6mA; Accuracy: 2%; Output Type: Fixed; Min Input Voltage: 7V; Dropout Voltage: 2V; Power Supply Rejection Ratio (PSRR): 68dB; Item Type: Regulator; Supplier: Mouser; Supplier Part Number: 511-L7805ABV; Manufacturer Part Number: L7805ABV; RoHS: Yes; Category: Voltage Regulators - Linear; Stock: 15048; Pricing: 1=0.75, 10=0.626, 50=0.626, 100=0.511, 1000=0.313, 10000=0.276 (USD); Mounting Technology: Through Hole; Case/Package: TO; Pins: 3; Min Operating Temperature: -40°C; Max Operating Temperature: 125°C; Output Voltage: 5V; Output Current: 1.5A; Packaging: Rail/Tube; Package Quantity: 50; Nominal Output Voltage: 5V; Number of Regulators: 1; Min Output Voltage: 5V; Max Output Voltage: 5V; Output Voltage Accuracy: 2%; Series: -; Output Configuration: Positive; Length: 10.4mm; Width: 4.6mm; Height: 9.15mm; Radiation Hardening: No; Reach SVHC Compliant: No; Lead Free: Lead Free; RoHS Compliant: Yes; ComponentLink1URL: https://datasheet.ciiva.com/1512/1696820-1512331.pdf?src-supplier=Element14; ComponentLink1Description: https://datasheet.ciiva.com/1512/1696820-1512331.pdf?src-supplier=Element14; ComponentLink2URL: https://datasheet.ciiva.com/2052/cd00000444-2052290.pdf?src-supplier=Digi-Key; ComponentLink2Description: https://datasheet.ciiva.com/2052/cd00000444-2052290.pdf?src-supplier=Digi-Key; ComponentLink3URL: https://datasheet.ciiva.com/1511/1805459-1511907.pdf?src-supplier=Element14; ComponentLink3Description: https://datasheet.ciiva.com/1511/1805459-1511907.pdf?src-supplier=Element14; LCSC Part Number: C16807